# Altium schematic sheet Sheet2.SchDoc
size A3; SheetNumber: 2; SheetTotal: 6
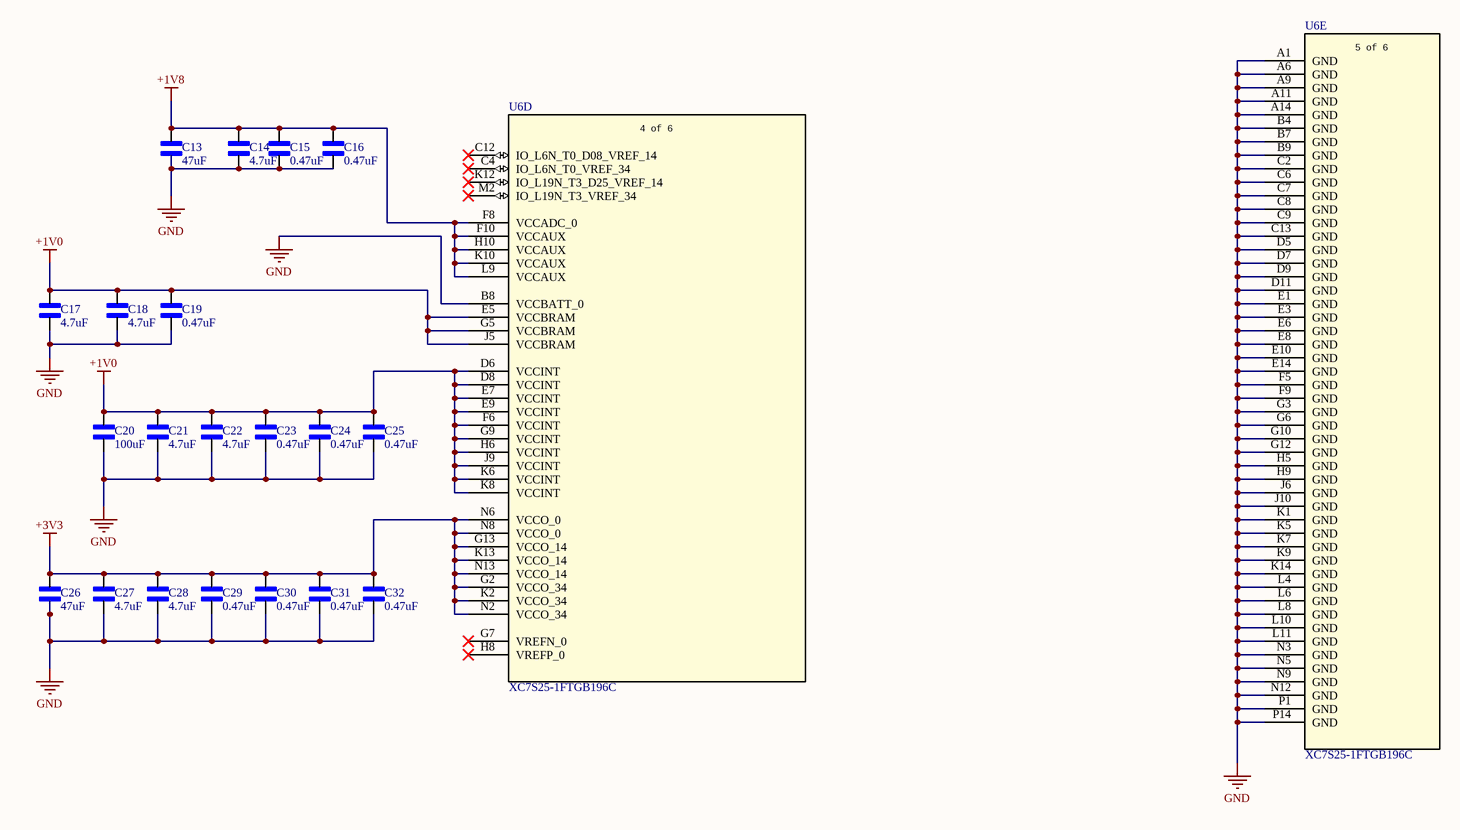
[diagram p0: Sheet2.SchDoc]

## Parts
C13  47uF  [GRM32ER70J476ME20L]
C14  4.7uF  [GRM21BR71A475KA73K]
C15  0.47uF  [GRM188R70J474KA01D]
C16  0.47uF  [GRM188R70J474KA01D]
C17  4.7uF  [GRM21BR71A475KA73K]
C18  4.7uF  [GRM21BR71A475KA73K]
C19  0.47uF  [GRM188R70J474KA01D]
C20  100uF  [GRM32ER60J107ME20L]
C21  4.7uF  [GRM21BR71A475KA73K]
C22  4.7uF  [GRM21BR71A475KA73K]
C23  0.47uF  [GRM188R70J474KA01D]
C24  0.47uF  [GRM188R70J474KA01D]
C25  0.47uF  [GRM188R70J474KA01D]
C26  47uF  [GRM32ER70J476ME20L]
C27  4.7uF  [GRM21BR71A475KA73K]
C28  4.7uF  [GRM21BR71A475KA73K]
C29  0.47uF  [GRM188R70J474KA01D]
C30  0.47uF  [GRM188R70J474KA01D]
C31  0.47uF  [GRM188R70J474KA01D]
C32  0.47uF  [GRM188R70J474KA01D]
U6  XC7S25-1FTGB196C  [FTGB196SPARTAN-7_AMD]  (parts D,E of 6)

## Nets
+1V0: C17.2 C18.2 C19.2 C20.2 C21.2 C22.2 C23.2 C24.2 C25.2 U6.D6(VCCINT) U6.D8(VCCINT) U6.E5(VCCBRAM) U6.E7(VCCINT) U6.E9(VCCINT) U6.F6(VCCINT) U6.G5(VCCBRAM) U6.G9(VCCINT) U6.H6(VCCINT) U6.J5(VCCBRAM) U6.J9(VCCINT) U6.K6(VCCINT) U6.K8(VCCINT)
+1V8: C13.2 C14.2 C15.2 C16.2 U6.F8(VCCADC_0) U6.F10(VCCAUX) U6.H10(VCCAUX) U6.K10(VCCAUX) U6.L9(VCCAUX)
+3V3: C26.2 C27.2 C28.2 C29.2 C30.2 C31.2 C32.2 U6.G2(VCCO_34) U6.G13(VCCO_14) U6.K2(VCCO_34) U6.K13(VCCO_14) U6.N2(VCCO_34) U6.N6(VCCO_0) U6.N8(VCCO_0) U6.N13(VCCO_14)
GND: C13.1 C14.1 C15.1 C16.1 C17.1 C18.1 C19.1 C20.1 C21.1 C22.1 C23.1 C24.1 C25.1 C26.1 C27.1 C28.1 C29.1 C30.1 C31.1 C32.1 U6.A1(GND) U6.A6(GND) U6.A9(GND) U6.A11(GND) U6.A14(GND) U6.B4(GND) U6.B7(GND) U6.B8(VCCBATT_0) U6.B9(GND) U6.C2(GND) U6.C6(GND) U6.C7(GND) U6.C8(GND) U6.C9(GND) U6.C13(GND) U6.D5(GND) U6.D7(GND) U6.D9(GND) U6.D11(GND) U6.E1(GND) U6.E3(GND) U6.E6(GND) U6.E8(GND) U6.E10(GND) U6.E14(GND) U6.F5(GND) U6.F9(GND) U6.G3(GND) U6.G6(GND) U6.G10(GND) U6.G12(GND) U6.H5(GND) U6.H9(GND) U6.J6(GND) U6.J10(GND) U6.K1(GND) U6.K5(GND) U6.K7(GND) U6.K9(GND) U6.K14(GND) U6.L4(GND) U6.L6(GND) U6.L8(GND) U6.L10(GND) U6.L11(GND) U6.N3(GND) U6.N5(GND) U6.N9(GND) U6.N12(GND) U6.P1(GND) U6.P14(GND)

Not connected (* = marked no-connect by the designer): U6 C4(IO_L6N_T0_VREF_34)* C12(IO_L6N_T0_D08_VREF_14)* G7(VREFN_0)* H8(VREFP_0)* K12(IO_L19N_T3_D25_VREF_14)* M2(IO_L19N_T3_VREF_34)*

## Notes on the sheet
- (in symbol XC7S25-1FTGB196C_1, part D) 4 of 6
- (in symbol XC7S25-1FTGB196C_1, part E) 5 of 6

## Library data of the parts
C13 C26 = GRM32ER70J476ME20L_1
C14 C17 C18 C21 C22 C27 C28 = GRM21BR71A475KA73K
C15 C16 C19 C23-C25 C29-C32 = GRM188R70J474KA01D
C20 = GRM32ER60J107ME20L
U6 = XC7S25-1FTGB196C_1: Description; Manufacturer_Name: AMD; Type: Embedded; Copyright: Copyright (C) 2025 Ultra Librarian. All rights reserved.; Manufacturer_Part_Number: XC7S25-1FTGB196C; RefDes: RefDes; Supplier: Arrow Electronics; Supplier Part Number: AD9226ARSZ